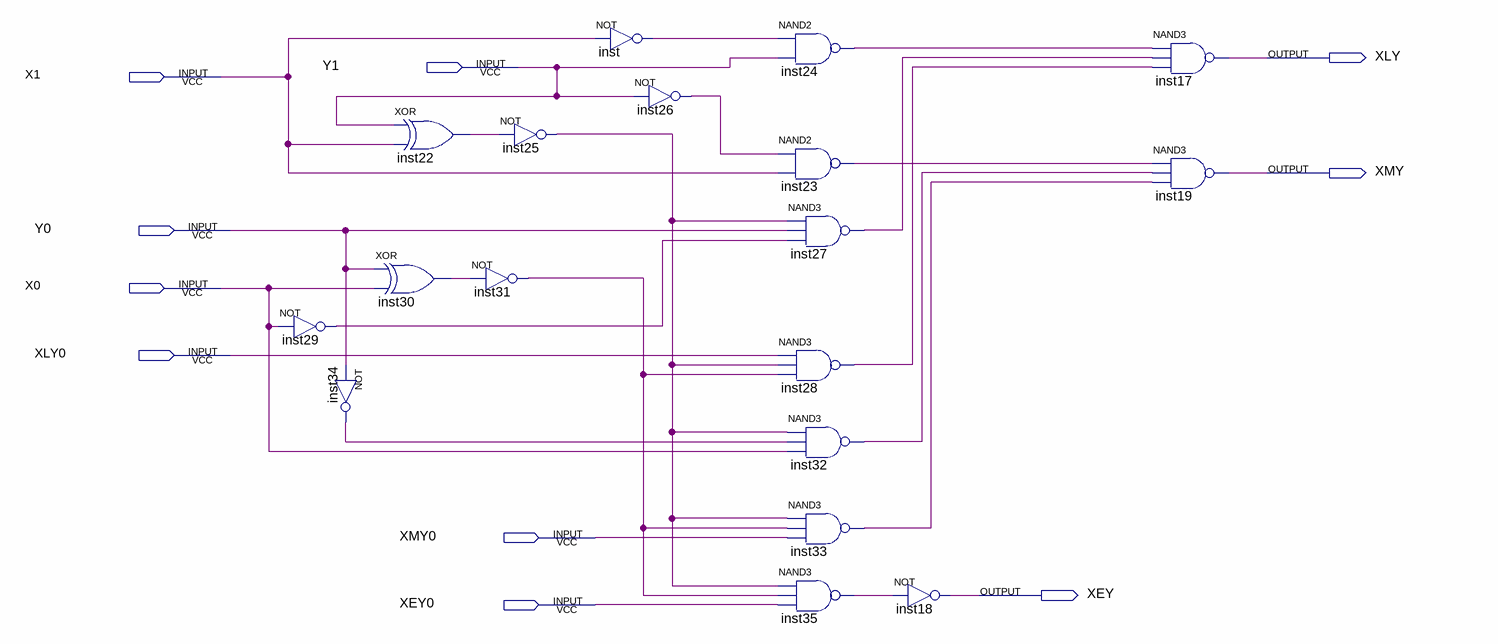
[diagram p0: schematic sheet]
// Quartus schematic CMP_2bit.bdf as structural Verilog: 18 symbols, 10 pins
module CMP_2bit (
  input  Y1,
  input  X1,
  input  Y0,
  input  X0,
  input  XLY0,
  input  XMY0,
  input  XEY0,
  output XLY,
  output XMY,
  output XEY
);

  wire inst22_out, inst23_out, inst24_out, inst25_out, inst26_out, inst27_out, inst28_out, inst29_out,
       inst30_out, inst31_out, inst32_out, inst33_out, inst34_out, inst35_out, inst_out;

  not inst29 (inst29_out, X0);
  xor inst22 (inst22_out, Y1, X1);
  xor inst30 (inst30_out, Y0, X0);
  not inst34 (inst34_out, Y0);
  not inst31 (inst31_out, inst30_out);
  not inst25 (inst25_out, inst22_out);
  not inst (inst_out, X1);
  not inst26 (inst26_out, Y1);
  nand inst24 (inst24_out, inst_out, Y1);
  nand inst23 (inst23_out, inst26_out, X1);
  nand inst28 (inst28_out, XLY0, inst25_out, inst31_out);
  nand inst35 (inst35_out, inst25_out, inst31_out, XEY0);
  nand inst27 (inst27_out, inst25_out, Y0, inst29_out);
  nand inst32 (inst32_out, inst25_out, inst34_out, X0);
  nand inst33 (inst33_out, inst25_out, inst31_out, XMY0);
  not inst18 (XEY, inst35_out);
  nand inst17 (XLY, inst24_out, inst27_out, inst28_out);
  nand inst19 (XMY, inst23_out, inst32_out, inst33_out);
endmodule
